# Altium schematic sheet Sheet1_Motor.SchDoc
size A2; SheetNumber: 1; SheetTotal: 5
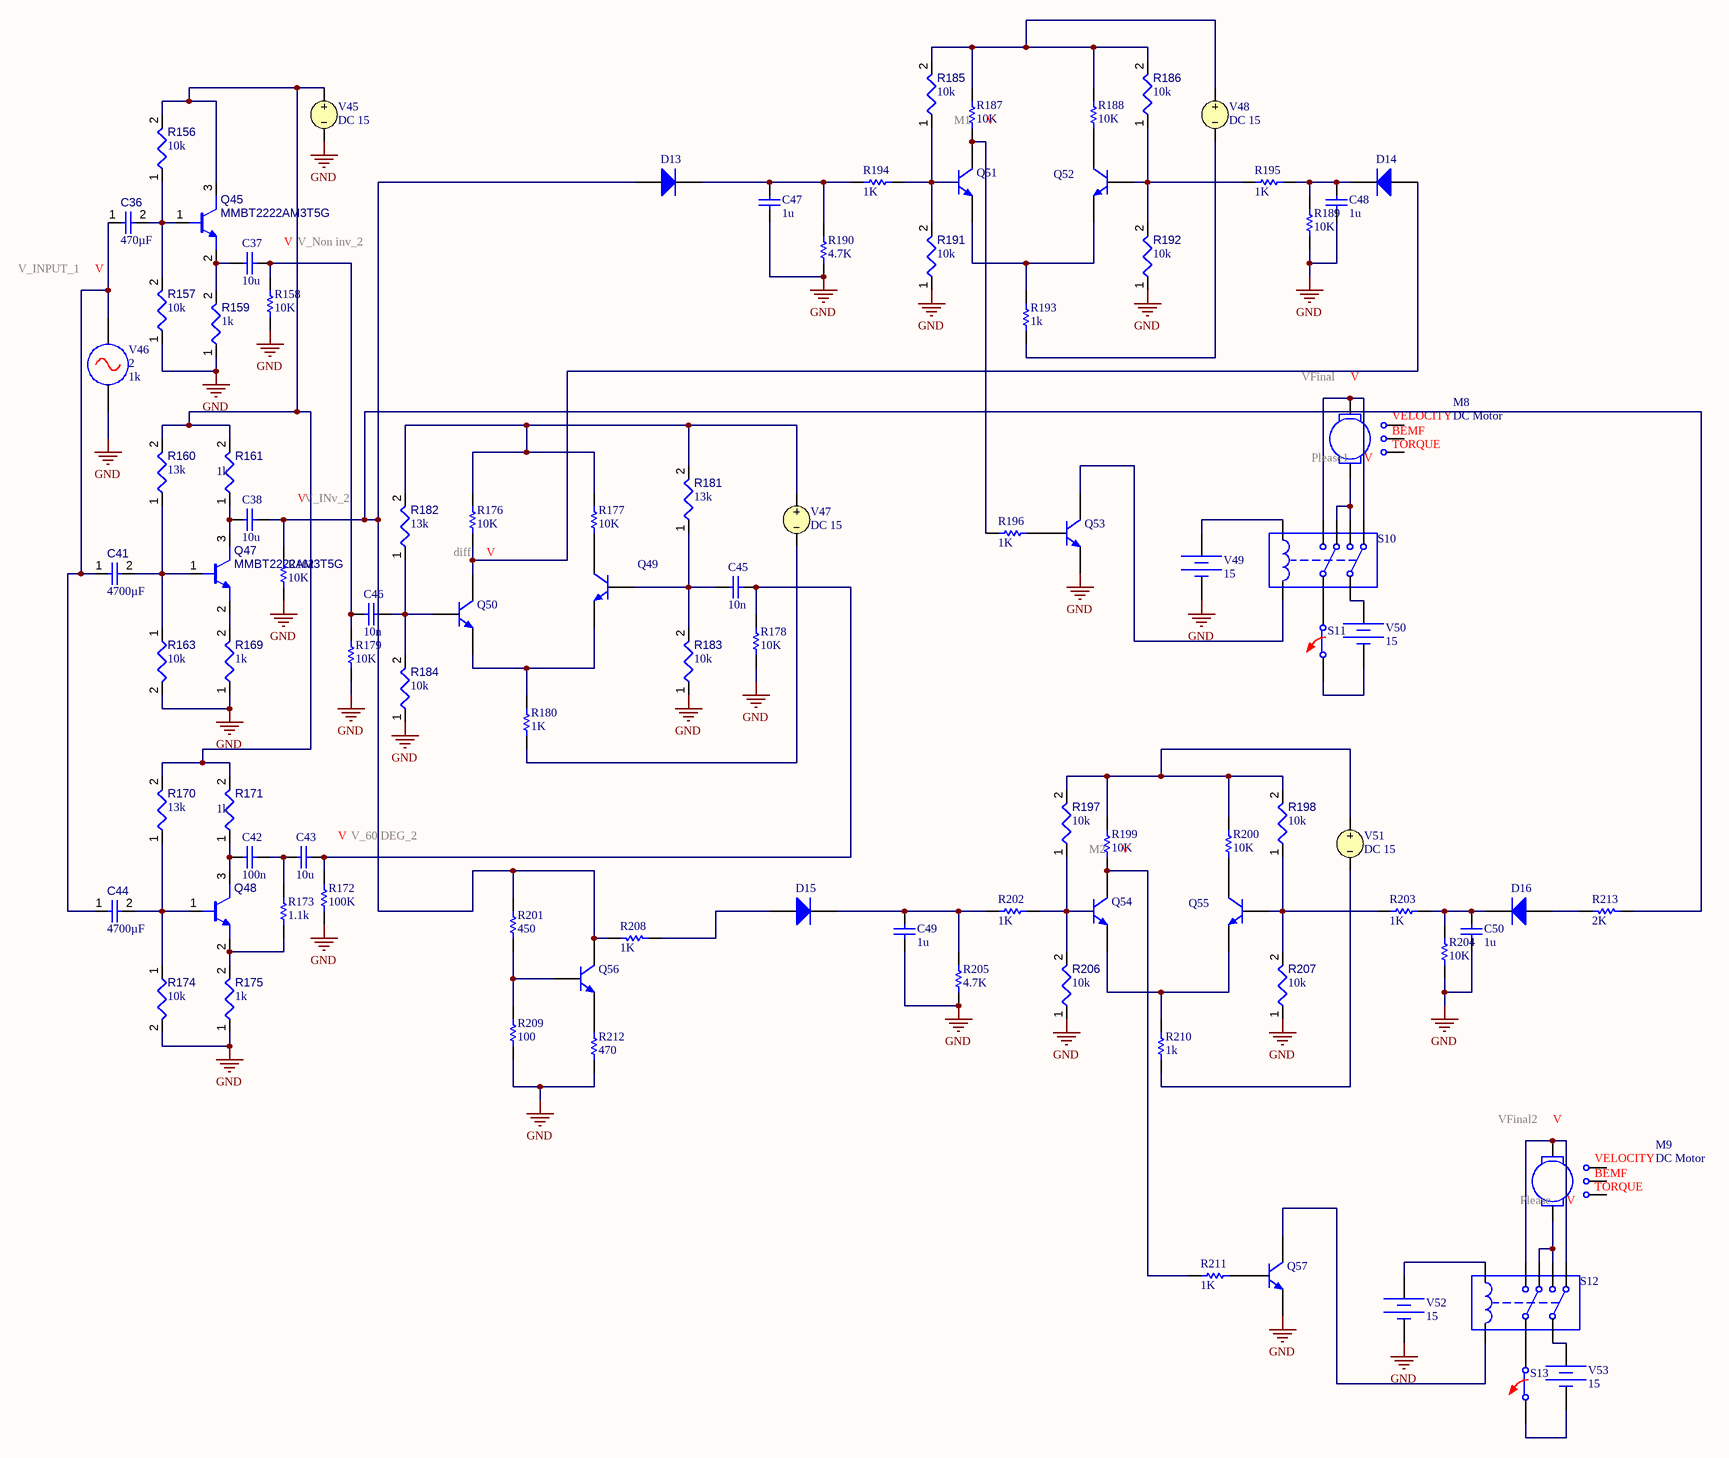
[diagram p0: Sheet1_Motor.SchDoc]

## Parts
C36  value 470µF  [CAPC1608X94X35NL15T15]  (hidden comment: Capacitor 1 uF +/- 10% 16 V 0603)
C37  value 10u  (hidden comment: Capacitor)
C38  value 10u  (hidden comment: Capacitor)
C41  value 4700µF  [CAPC1608X94X35NL15T15]  (hidden comment: Capacitor 1 uF +/- 10% 16 V 0603)
C42  value 100n  (hidden comment: Capacitor)
C43  value 10u  (hidden comment: Capacitor)
C44  value 4700µF  [CAPC1608X94X35NL15T15]  (hidden comment: Capacitor 1 uF +/- 10% 16 V 0603)
C45  value 10n  (hidden comment: Capacitor)
C46  value 10n  (hidden comment: Capacitor)
C47  value 1u  (hidden comment: Capacitor)
C48  value 1u  (hidden comment: Capacitor)
C49  value 1u  (hidden comment: Capacitor)
C50  value 1u  (hidden comment: Capacitor)
D13  Diode  (value not drawn)
D14  Diode  (value not drawn)
D15  Diode  (value not drawn)
D16  Diode  (value not drawn)
M8  DC Motor
M9  DC Motor
Q45  MMBT2222AM3T5G  [ROHM-SOT723-3_V]
Q47  MMBT2222AM3T5G  [ROHM-SOT723-3_V]
Q48  MMBT2222AM3T5G  [ROHM-SOT723-3_V]  (value not drawn)
Q49  Bipolar NPN 3 Pins Transistor VBIC Model  (value not drawn)
Q50  Bipolar NPN 3 Pins Transistor VBIC Model  (value not drawn)
Q51  Bipolar NPN 3 Pins Transistor VBIC Model  (value not drawn)
Q52  Bipolar NPN 3 Pins Transistor VBIC Model  (value not drawn)
Q53  Bipolar NPN 3 Pins Transistor VBIC Model  (value not drawn)
Q54  Bipolar NPN 3 Pins Transistor VBIC Model  (value not drawn)
Q55  Bipolar NPN 3 Pins Transistor VBIC Model  (value not drawn)
Q56  Bipolar NPN 3 Pins Transistor VBIC Model  (value not drawn)
Q57  Bipolar NPN 3 Pins Transistor VBIC Model  (value not drawn)
R156  value 10k  [RESC0402(1005)_L]  (hidden comment: 0R2J)
R157  value 10k  [RESC0402(1005)_L]  (hidden comment: 0R2J)
R158  value 10K  (hidden comment: Resistor)
R159  value 1k  [RESC0402(1005)_L]  (hidden comment: 0R2J)
R160  value 13k  [RESC0402(1005)_L]  (hidden comment: 0R2J)
R161  value 1k  [RESC0402(1005)_L]  (hidden comment: 0R2J)
R162  value 10K  (hidden comment: Resistor)
R163  value 10k  [RESC0402(1005)_L]  (hidden comment: 0R2J)
R169  value 1k  [RESC0402(1005)_L]  (hidden comment: 0R2J)
R170  value 13k  [RESC0402(1005)_L]  (hidden comment: 0R2J)
R171  value 1k  [RESC0402(1005)_L]  (hidden comment: 0R2J)
R172  value 100K  (hidden comment: Resistor)
R173  value 1.1k  (hidden comment: Resistor)
R174  value 10k  [RESC0402(1005)_L]  (hidden comment: 0R2J)
R175  value 1k  [RESC0402(1005)_L]  (hidden comment: 0R2J)
R176  value 10K  (hidden comment: Resistor)
R177  value 10K  (hidden comment: Resistor)
R178  value 10K  (hidden comment: Resistor)
R179  value 10K  (hidden comment: Resistor)
R180  value 1K  (hidden comment: Resistor)
R181  value 13k  [RESC0402(1005)_L]  (hidden comment: 0R2J)
R182  value 13k  [RESC0402(1005)_L]  (hidden comment: 0R2J)
R183  value 10k  [RESC0402(1005)_L]  (hidden comment: 0R2J)
R184  value 10k  [RESC0402(1005)_L]  (hidden comment: 0R2J)
R185  value 10k  [RESC0402(1005)_L]  (hidden comment: 0R2J)
R186  value 10k  [RESC0402(1005)_L]  (hidden comment: 0R2J)
R187  value 10K  (hidden comment: Resistor)
R188  value 10K  (hidden comment: Resistor)
R189  value 10K  (hidden comment: Resistor)
R190  value 4.7K  (hidden comment: Resistor)
R191  value 10k  [RESC0402(1005)_L]  (hidden comment: 0R2J)
R192  value 10k  [RESC0402(1005)_L]  (hidden comment: 0R2J)
R193  value 1k  (hidden comment: Resistor)
R194  value 1K  (hidden comment: Resistor)
R195  value 1K  (hidden comment: Resistor)
R196  value 1K  (hidden comment: Resistor)
R197  value 10k  [RESC0402(1005)_L]  (hidden comment: 0R2J)
R198  value 10k  [RESC0402(1005)_L]  (hidden comment: 0R2J)
R199  value 10K  (hidden comment: Resistor)
R200  value 10K  (hidden comment: Resistor)
R201  value 450  (hidden comment: Resistor)
R202  value 1K  (hidden comment: Resistor)
R203  value 1K  (hidden comment: Resistor)
R204  value 10K  (hidden comment: Resistor)
R205  value 4.7K  (hidden comment: Resistor)
R206  value 10k  [RESC0402(1005)_L]  (hidden comment: 0R2J)
R207  value 10k  [RESC0402(1005)_L]  (hidden comment: 0R2J)
R208  value 1K  (hidden comment: Resistor)
R209  value 100  (hidden comment: Resistor)
R210  value 1k  (hidden comment: Resistor)
R211  value 1K  (hidden comment: Resistor)
R212  value 470  (hidden comment: Resistor)
R213  value 2K  (hidden comment: Resistor)
S10  Double-Pole, Double-Throw Relay  (value not drawn)
S11  Switch Normally Closed  (value not drawn)
S12  Double-Pole, Double-Throw Relay  (value not drawn)
S13  Switch Normally Closed  (value not drawn)
V45  DC 15
V46  Amp: 2  Freq: 1k  (hidden comment: AC Voltage Source)
V47  DC 15
V48  DC 15
V49  DC Magnitude: 15  (hidden comment: Constant Voltage Source)
V50  DC Magnitude: 15  (hidden comment: Constant Voltage Source)
V51  DC 15
V52  DC Magnitude: 15  (hidden comment: Constant Voltage Source)
V53  DC Magnitude: 15  (hidden comment: Constant Voltage Source)

## Nets
GND: C47.1 C48.1 C49.1 C50.1 Q53.3(E) Q57.3(E) R157.1 R158.1 R159.1 R162.1 R163.2 R169.1 R172.1 R174.2 R175.1 R178.1 R179.1 R183.1 R184.1 R189.1 R190.1 R191.1 R192.1 R204.1 R205.1 R206.1 R207.1 R209.1 R212.1 V45.2 V46.2 V49.2 V52.2
NetC36_1: C36.1 C41.1 C44.1 V46.1
NetC36_2: C36.2 Q45.1(B) R156.1 R157.2
NetC37_1: C37.1 Q45.2(E) R159.2
NetC37_2: C37.2 C46.1 R158.2 R179.2
NetC38_1: C38.1 Q47.3(C) R161.1
NetC38_2: C38.2 D13.1(A) Q56.1(C) R162.2 R201.2 R208.2 R213.1
NetC41_2: C41.2 Q47.1(B) R160.1 R163.1
NetC42_1: C42.1 Q48.3(C) R171.1
NetC42_2: C42.2 C43.1 R173.2
NetC43_2: C43.2 C45.2 R172.2 R178.2
NetC44_2: C44.2 Q48.1(B) R170.1 R174.1
NetC45_1: C45.1 Q49.2(B) R181.1 R183.2
NetC46_2: C46.2 Q50.2(B) R182.1 R184.2
NetC47_2: C47.2 D13.2(K) R190.2 R194.2
NetC48_2: C48.2 D14.2(K) R189.2 R195.1
NetC49_2: C49.2 D15.2(K) R202.2 R205.2
NetC50_2: C50.2 D16.2(K) R203.1 R204.2
NetD14_1: D14.1(A) Q50.1(C) R176.1
NetD15_1: D15.1(A) R208.1
NetD16_1: D16.1(A) R213.2
NetM8_1: M8.1 S10.3 S10.5
NetM8_2: M8.2 S10.2 S10.6
NetM9_1: M9.1 S12.3 S12.5
NetM9_2: M9.2 S12.2 S12.6
NetQ45_3: Q45.3(C) R156.2 R160.2 R161.2 R170.2 R171.2 V45.1
NetQ47_2: Q47.2(E) R169.2
NetQ48_2: Q48.2(E) R173.1 R175.2
NetQ49_1: Q49.1(C) R177.1
NetQ49_3: Q49.3(E) Q50.3(E) R180.2
NetQ51_1: Q51.1(C) R187.1 R196.1
NetQ51_2: Q51.2(B) R185.1 R191.2 R194.1
NetQ51_3: Q51.3(E) Q52.3(E) R193.2
NetQ52_1: Q52.1(C) R188.1
NetQ52_2: Q52.2(B) R186.1 R192.2 R195.2
NetQ53_1: Q53.1(C) S10.7
NetQ53_2: Q53.2(B) R196.2
NetQ54_1: Q54.1(C) R199.1 R211.1
NetQ54_2: Q54.2(B) R197.1 R202.1 R206.2
NetQ54_3: Q54.3(E) Q55.3(E) R210.2
NetQ55_1: Q55.1(C) R200.1
NetQ55_2: Q55.2(B) R198.1 R203.2 R207.2
NetQ56_2: Q56.2(B) R201.1 R209.2
NetQ56_3: Q56.3(E) R212.2
NetQ57_1: Q57.1(C) S12.7
NetQ57_2: Q57.2(B) R211.2
NetR176_2: R176.2 R177.2 R181.2 R182.2 V47.1
NetR180_1: R180.1 V47.2
NetR185_2: R185.2 R186.2 R187.2 R188.2 V48.1
NetR193_1: R193.1 V48.2
NetR197_2: R197.2 R198.2 R199.2 R200.2 V51.1
NetR210_1: R210.1 V51.2
NetS10_1: S10.1 V50.1
NetS10_4: S10.4 S11.2
NetS10_8: S10.8 V49.1
NetS11_1: S11.1 V50.2
NetS12_1: S12.1 V53.1
NetS12_4: S12.4 S13.2
NetS12_8: S12.8 V52.1
NetS13_1: S13.1 V53.2

Not connected (* = marked no-connect by the designer): M8 3 4 5; M9 3 4 5

## Notes on the sheet
- (in symbol DC Motor) VELOCITY; BEMF; TORQUE

## Library data of the parts
C36 C41 C44 = CMP-001-00003-6: Chip Capacitor, 1 uF, +/- 10%, 16 V, 0603 (1608 Metric); Voltage Rating: 16V; Capacitor Type: Ceramic; Max Operating Temperature: 125°C; Pins: 2; Tolerance: 10%; Min Operating Temperature: -55°C; RoHS Compliant: True; Mounting Technology: SM; Case/Package: 0603
C37 C38 C42 C43 C45-C50 = Capacitor: SimulationGenericComponent: True
D13-D16 = Diode: AF: 1; BV: 0; BV_MAX: 1e99; EG: 1.11; FC: 0.5; IBV: 0.001; ISR: 1e-14; MJSW: 0.33; NTUN: 30; TNOM: 27; XTI: 3; SimulationGenericComponent: True; CJO: 0; CJP: 0; CTA: 0; CTP: 0; FCS: 0.5; FV_MAX: 1e99; IKF: 0; IKR: 0; JSW: 0; JTUN: 0; JTUNSW: 0; KEG: 1; KF: 0; LEVEL: 1; N: 1; NBV: 1; NR: 1; NS: 1; PHP: 1; RS: 0; TCV: 0; TLEV: 0; TLEVC: 0; TM1: 0; TM2: 0; TPB: 0; TPHP: 0; TRS: 0; TRS2: 0; TT: 0; TTT1: 0; TTT2: 0; VJ: 1; XTITUN: 3; IS: 1e-14
M8 M9 = DC Motor: LA: 1.5M; RA: 0.5; KE: 0.05; JM: 250U; BM: 0.1M; TL: 0; SimulationGenericComponent: True; KT: 0.05
Q45 Q47 Q48 = CMP-013-00028-2: NPN General Purpose Transistor, 3-Pin SOT-723, Pb-Free, Tape and Reel; ComponentLink3Description: Package Specification; ComponentLink1URL: http://www.onsemi.com/; ComponentLink3URL: http://www.onsemi.com/pub_link/Collateral/631AA.PDF; ComponentLink2Description: Datasheet; Mounting Technology: SMT; Pins: 3; Case/Package: SOT-723; RoHS Compliant: TRUE; ComponentLink1Description: Manufacturer URL; ComponentLink2URL: http://www.onsemi.cn/pub_link/Collateral/MMBT2222AM3-D.PDF
Q49-Q57 = BJT NPN VBIC: SimulationGenericComponent: True; AFN: 1; AJC: -0.5; ART: 0.1; AVC1: 0; EA: 1.12; FC: 0.9; IBBE: 1e-06; IBCI: 1e-16; IBEI: 1e-18; MC: 0.33; NCN: 2; NKF: 0.5; PC: 0.75; TNOM: 27; VERS: 1.2; XII: 3; AJE: -0.5; AJS: -0.5; AVC2: 0; BFN: 1; CBCO: 0; CBEO: 0; CCSO: 0; CJC: 0; CJCP: 0; CJE: 0; CJEP: 0; CTH: 0; DEAR: 0; EAIC: 1.12; EAIE: 1.12; EAIS: 1.12; EANC: 1.12; EANE: 1.12; EANS: 1.12; EAP: 1.12; EBBE: 0; GAMM: 0; HRCF: 1; IBCIP: 0; IBCN: 0; IBCNP: 0; IBEIP: 0; IBEN: 0; IBENP: 0; IKF: 0; IKP: 0; IKR: 0; IS: 1e-16; ISP: 0; ISRR: 1; ITF: 0; KFN: 0; ME: 0.33; MS: 0.33; NBBE: 1; NCI: 1; NCIP: 1; NCNP: 2; NEI: 1; NEN: 2; NF: 1; NFP: 1; NR: 1; PE: 0.75; PS: 0.75; QBM: 0; QCO: 0; QTF: 0; RBI: 0.1; RBP: 0.1; RBX: 0; RCI: 0.1; RCX: 0; RE: 0; RS: 0; RTH: 0; TAVC: 0; TD: 0; TF: 0; TNBBE: 0; TNF: 0; TR: 0; TVBBE1: 0; TVBBE2: 0; VBBE: 0; VEF: 0; VER: 0; VO: 0; VREF: 0; VRT: 0; VTF: 0; WBE: 1; WSP: 1; XIKF: 0; XIN: 3; XIS: 3; XISR: 0; XRBI: 0; XRBP: 0; XRBX: 0; XRCI: 0; XRCX: 0; XRE: 0; XRS: 0; XTF: 0; XVO: 0
R156 R157 R159-R161 R163 R169-R171 R174 R175 R181-R186 R191 R192 R197 R198 R206 R207 = CMP-009-00062-2: Jumper 0402 (1005 Metric); Pins: 2; Mounting Technology: SMT; Case/Package: 0402
R158 R162 R172 R173 R176-R180 R187-R190 R193-R196 R199-R205 R208-R213 = Resistor: TC1: 0; SimulationGenericComponent: True; TC2: 0
S10 S12 = DPDT Relay: L_C: 1u; R_C: 100; RON: 1; ROFF: 1e12; ION: 1m; IOFF: 0; SimulationGenericComponent: True
S11 S13 = SW NC: closed: 1; Rclosed: 1m; Ropen: 1Meg; SimulationGenericComponent: True
V45 V47 V48 V51 = VSRC: Voltage Source; Note: PCB Footprint - Not required; AC Magnitude: 1; AC Phase: 0; Value: 15; Published: 8-Jun-2000; LatestRevisionDate: 17-Jul-2002; LatestRevisionNote: Re-released for DXP Platform.; PackageReference: Not Applicable; Publisher: Altium Limited
V46 = AC Voltage Source: SimulationGenericComponent: True; DC: 0; Phase: 0; Rser: 0; Cpar: 0
V49 V50 V52 V53 = Battery: SimulationGenericComponent: True